# EAGLE design PCB_Robotique_V3 (EAGLE 8.4.3)
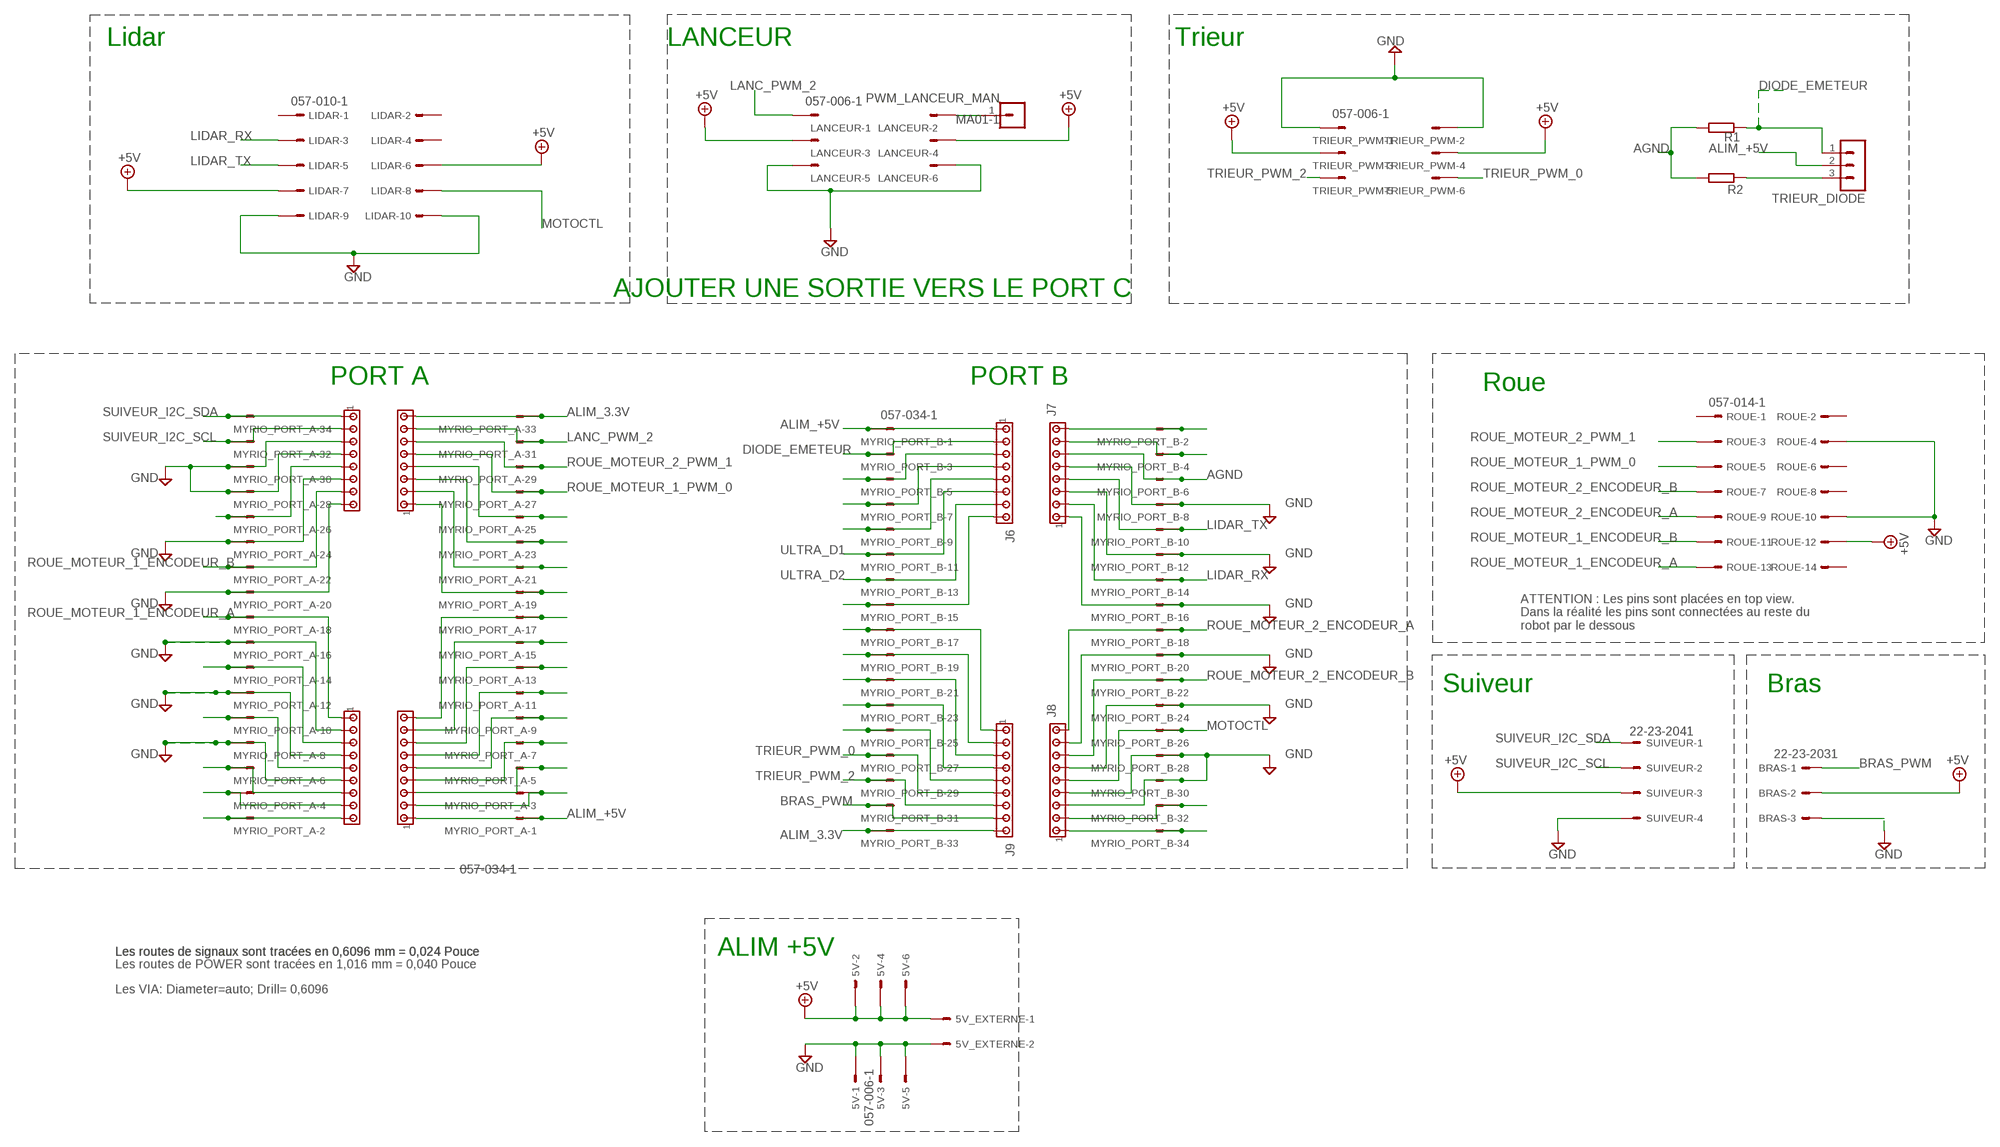
[diagram p0: schematic, sheet 1]

## Parts
5V  057-006-1  [057-006-1]
5V_EXTERNE  KK-156-2  [KK-156-2]
BRAS  22-23-2031  [22-23-2031]
J2  MTA08-100  [10X08MTA]
J3  MTA08-100  [10X08MTA]
J4  MTA09-100  [10X09MTA]
J5  MTA09-100  [10X09MTA]
J6  MTA08-100  [10X08MTA]
J7  MTA08-100  [10X08MTA]
J8  MTA09-100  [10X09MTA]
J9  MTA09-100  [10X09MTA]
LANCEUR  057-006-1  [057-006-1]
LIDAR  057-010-1  [057-010-1]
MYRIO_PORT_A  057-034-1  [057-034-1]
MYRIO_PORT_B  057-034-1  [057-034-1]
PWM_LANCEUR_MAN  MA01-1  [MA01-1]
R1  15K  R1/4W  [R]
R2  180  R1/4W  [R]
ROUE  057-014-1  [057-014-1]
SUIVEUR  22-23-2041  [22-23-2041]
TRIEUR_DIODE  MA03-1  [MA03-1]
TRIEUR_PWM  057-006-1  [057-006-1]

## Nets
4B: J7.7 MYRIO_PORT_B.4
+5V: 5V.2 5V.4 5V.6 5V_EXTERNE.1 BRAS.2 LANCEUR.3 LANCEUR.4 LIDAR.6 LIDAR.7 ROUE.12 SUIVEUR.3 TRIEUR_PWM.3 TRIEUR_PWM.4
AGND: J7.6 MYRIO_PORT_B.6 R1.1 R2.2
ALIM_3.3V: J3.8 J9.9 MYRIO_PORT_A.33 MYRIO_PORT_B.33
ALIM_+5V: J4.1 J6.1 MYRIO_PORT_A.1 MYRIO_PORT_B.1 TRIEUR_DIODE.2
BRAS_PWM: BRAS.1 J9.8 MYRIO_PORT_B.31
DIODE: R2.1 TRIEUR_DIODE.3
DIODE_EMETEUR: J6.2 MYRIO_PORT_B.3 R1.2 TRIEUR_DIODE.1
GND: 5V.1 5V.3 5V.5 5V_EXTERNE.2 BRAS.3 J2.3 J2.4 J2.6 J2.8 J5.2 J5.4 J5.6 J7.1 J7.3 J7.5 J8.3 J8.4 J8.6 J8.8 LANCEUR.5 LANCEUR.6 LIDAR.9 LIDAR.10 MYRIO_PORT_A.8 MYRIO_PORT_A.12 MYRIO_PORT_A.16 MYRIO_PORT_A.20 MYRIO_PORT_A.24 MYRIO_PORT_A.28 MYRIO_PORT_A.30 MYRIO_PORT_B.8 MYRIO_PORT_B.12 MYRIO_PORT_B.16 MYRIO_PORT_B.20 MYRIO_PORT_B.24 MYRIO_PORT_B.28 MYRIO_PORT_B.30 ROUE.4 ROUE.10 SUIVEUR.4 TRIEUR_PWM.1 TRIEUR_PWM.2
LANC_PWM_2: J3.7 LANCEUR.1 MYRIO_PORT_A.31
LIDAR_RX: J7.2 LIDAR.3 MYRIO_PORT_B.14
LIDAR_TX: J7.4 LIDAR.5 MYRIO_PORT_B.10
MOTOCTL: J8.5 LIDAR.8 MYRIO_PORT_B.26
N$3: J2.5 MYRIO_PORT_A.26
N$7: J7.8 MYRIO_PORT_B.2
N$13: J5.8 MYRIO_PORT_A.4
N$14: J5.9 MYRIO_PORT_A.2
N$16: J3.4 MYRIO_PORT_A.25
N$17: J3.3 MYRIO_PORT_A.23
N$18: J3.2 MYRIO_PORT_A.21
N$19: J3.1 MYRIO_PORT_A.19
N$20: J4.9 MYRIO_PORT_A.17
N$24: J4.8 MYRIO_PORT_A.15
N$25: J4.7 MYRIO_PORT_A.13
N$26: J4.6 MYRIO_PORT_A.11
N$27: J4.5 MYRIO_PORT_A.9
N$28: J4.4 MYRIO_PORT_A.7
N$29: J4.3 MYRIO_PORT_A.5
N$30: J4.2 MYRIO_PORT_A.3
N$38: J8.2 MYRIO_PORT_B.32
N$39: J8.1 MYRIO_PORT_B.34
N$41: J9.5 MYRIO_PORT_B.25
N$42: J9.4 MYRIO_PORT_B.23
N$43: J9.3 MYRIO_PORT_B.21
N$44: J9.2 MYRIO_PORT_B.19
N$45: J9.1 MYRIO_PORT_B.17
N$46: J6.8 MYRIO_PORT_B.15
N$47: J6.5 MYRIO_PORT_B.9
N$48: J6.4 MYRIO_PORT_B.7
N$49: J6.3 MYRIO_PORT_B.5
N$59: J5.7 MYRIO_PORT_A.6
PWM_LANCEUR_MAN: LANCEUR.2 PWM_LANCEUR_MAN.1
ROUE_MOTEUR_1_ENCODEUR_A: J5.1 MYRIO_PORT_A.18 ROUE.13
ROUE_MOTEUR_1_ENCODEUR_B: J2.7 MYRIO_PORT_A.22 ROUE.11
ROUE_MOTEUR_1_PWM_0: J3.5 MYRIO_PORT_A.27 ROUE.5
ROUE_MOTEUR_2_ENCODEUR_A: J8.9 MYRIO_PORT_B.18 ROUE.9
ROUE_MOTEUR_2_ENCODEUR_B: J8.7 MYRIO_PORT_B.22 ROUE.7
ROUE_MOTEUR_2_PWM_1: J3.6 MYRIO_PORT_A.29 ROUE.3
SDFSDFSGD: J5.5 MYRIO_PORT_A.10
SDSSDFD: J5.3 MYRIO_PORT_A.14
SUIVEUR_I2C_SCL: J2.2 MYRIO_PORT_A.32 SUIVEUR.2
SUIVEUR_I2C_SDA: J2.1 MYRIO_PORT_A.34 SUIVEUR.1
TRIEUR_PWM_0: J9.6 MYRIO_PORT_B.27 TRIEUR_PWM.6
TRIEUR_PWM_2: J9.7 MYRIO_PORT_B.29 TRIEUR_PWM.5
ULTRA_D1: J6.6 MYRIO_PORT_B.11
ULTRA_D2: J6.7 MYRIO_PORT_B.13
Unconnected: LIDAR.1 LIDAR.2 LIDAR.4 ROUE.1 ROUE.2 ROUE.6 ROUE.8 ROUE.14

## Notes on the sheet
- Lidar | LANCEUR | Trieur
- AJOUTER UNE SORTIE VERS LE PORT C
- PORT A | PORT B
- Roue
- ATTENTION : Les pins sont placées en top view. 
  Dans la réalité les pins sont connectées au reste du 
  robot par le dessous
- Suiveur | Bras
- Les routes de signaux sont tracées en 0,6096 mm = 0,024 Pouce | Les routes de signaux sont tracées en 0,6096 mm = 0,024 Pouce | ALIM +5V
- Les routes de POWER sont tracées en 1,016 mm = 0,040 Pouce
- Les VIA: Diameter=auto; Drill= 0,6096

## Library data of the parts
5V LANCEUR TRIEUR_PWM = con-panduit:057-006-: CONNECTOR 6-pin series 057 contact pc board low profile headers; OC_FARNELL: unknown; OC_NEWARK: unknown
5V_EXTERNE = isenproject:KK-156-2: KK 156 HEADER Source: http://www.molex.com/pdm_docs/sd/026604100_sd.pdf; OC_FARNELL: unknown; OC_NEWARK: unknown
BRAS = con-molex:22-23-2031: .100" (2.54mm) Center Header - 3 Pin; MF: MOLEX; MPN: 22-23-2031; OC_FARNELL: 1462950; OC_NEWARK: 30C0862
J2 J3 J6 J7 = con-amp:MTA08-100: AMP connector
J4 J5 J8 J9 = con-amp:MTA09-100: AMP connector
LIDAR = con-panduit:057-010-: CONNECTOR 10-pin series 057 contact pc board low profile headers; OC_FARNELL: unknown; OC_NEWARK: unknown
MYRIO_PORT_A MYRIO_PORT_B = con-panduit:057-034-: CONNECTOR 34-pin series 057 contact pc board low profile headers; OC_FARNELL: unknown; OC_NEWARK: unknown
PWM_LANCEUR_MAN = connecteurs_males:MA01-1
R1 R2 = isenproject:R: RESISTOR, European symbol
ROUE = con-panduit:057-014-: CONNECTOR 10-pin series 057 contact pc board low profile headers; OC_FARNELL: unknown; OC_NEWARK: unknown
SUIVEUR = con-molex:22-23-2041: .100" (2.54mm) Center Header - 4 Pin; MF: MOLEX; MPN: 22-23-2041; OC_FARNELL: 1462920; OC_NEWARK: 38C0355
TRIEUR_DIODE = connecteurs_males:MA03-1: PIN HEADER; OC_FARNELL: unknown; OC_NEWARK: unknown

## Board
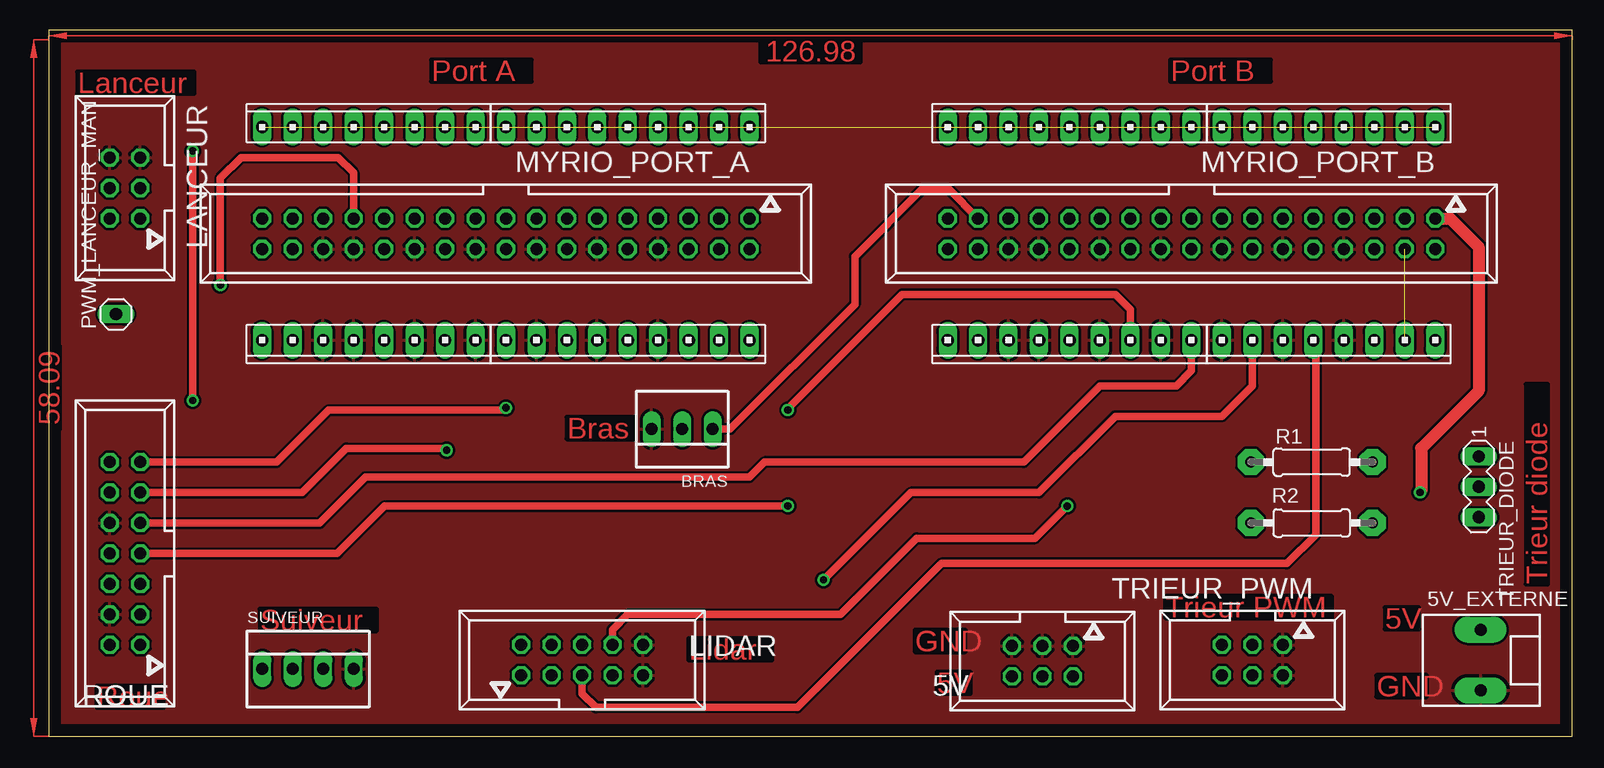
[diagram p1: board, top side]
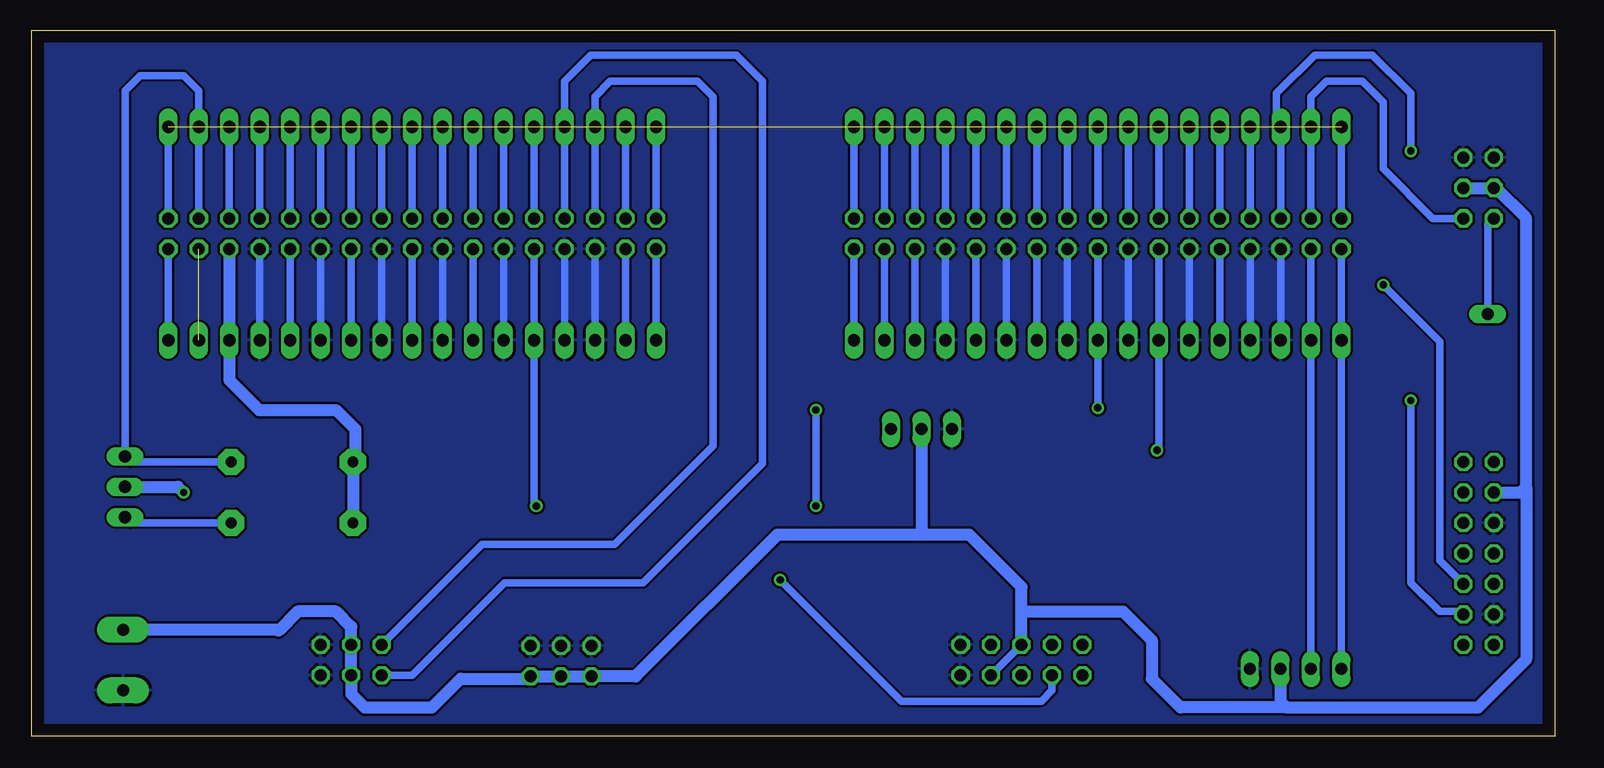
[diagram p2: board, bottom side, seen from below]

Size 126.98 x 58.89 mm. Coordinates in mm from the lower left corner, seen from the top.
Outline: 0,0 126.98,0 126.98,58.89 0,58.89 0,0
Copper layers (1*16): Top 0.035mm / dielectric 1.5mm / Bottom 0.035mm
Design rules "default": minimum track width 10mil, minimum drill 24mil, track to track 8mil, track to pad 8mil, pad to pad 8mil, via to via 8mil, smd to smd 8mil, copper to edge 40mil, drill to drill 8mil, minimum pad ring 10mil, minimum via ring 8mil, stop-mask expansion 4mil, vias tented up to drill 0mil, thermal gap 10mil

### Footprints (pad centres in the part's own frame; a part is rotated, then mirrored left to right if it is on the bottom)
057-006-1 = drill 1 octagon: 1 -2.54,-1.27; 2 -2.54,1.27; 3 0,-1.27; 4 0,1.27; 5 2.54,-1.27; 6 2.54,1.27
KK-156-2 = drill 1 pad 2.184 long: 1 -2.54,0; 2 2.54,0
22-23-2031 = drill 1 long: 1 -2.54,0; 2 0,0; 3 2.54,0
10X08MTA = drill 1.016 long: 1 8.89,0; 2 6.35,0; 3 3.81,0; 4 1.27,0; 5 -1.27,0; 6 -3.81,0; 7 -6.35,0; 8 -8.89,0
10X09MTA = drill 1.016 long: 1 10.16,0; 2 7.62,0; 3 5.08,0; 4 2.54,0; 5 0,0; 6 -2.54,0; 7 -5.08,0; 8 -7.62,0; 9 -10.16,0
057-010-1 = drill 1 octagon: 1 -5.08,-1.27; 2 -5.08,1.27; 3 -2.54,-1.27; 4 -2.54,1.27; 5 0,-1.27; 6 0,1.27; 7 2.54,-1.27; 8 2.54,1.27; 9 5.08,-1.27; 10 5.08,1.27
057-034-1 = drill 1 octagon: 1 -20.32,-1.27; 2 -20.32,1.27; 3 -17.78,-1.27; 4 -17.78,1.27; 5 -15.24,-1.27; 6 -15.24,1.27; 7 -12.7,-1.27; 8 -12.7,1.27; 9 -10.16,-1.27; 10 -10.16,1.27; 11 -7.62,-1.27; 12 -7.62,1.27; 13 -5.08,-1.27; 14 -5.08,1.27; 15 -2.54,-1.27; 16 -2.54,1.27; 17 0,-1.27; 18 0,1.27; 19 2.54,-1.27; 20 2.54,1.27; 21 5.08,-1.27; 22 5.08,1.27; 23 7.62,-1.27; 24 7.62,1.27; 25 10.16,-1.27; 26 10.16,1.27; 27 12.7,-1.27; 28 12.7,1.27; 29 15.24,-1.27; 30 15.24,1.27; 31 17.78,-1.27; 32 17.78,1.27; 33 20.32,-1.27; 34 20.32,1.27
MA01-1 = drill 1.016 long: 1 0,0
R = drill 0.9 pad 2.184 octagon: 1 -5.08,0; 2 5.08,0
057-014-1 = drill 1 octagon: 1 -7.62,-1.27; 2 -7.62,1.27; 3 -5.08,-1.27; 4 -5.08,1.27; 5 -2.54,-1.27; 6 -2.54,1.27; 7 0,-1.27; 8 0,1.27; 9 2.54,-1.27; 10 2.54,1.27; 11 5.08,-1.27; 12 5.08,1.27; 13 7.62,-1.27; 14 7.62,1.27
22-23-2041 = drill 1 long: 1 -3.81,0; 2 -1.27,0; 3 1.27,0; 4 3.81,0
MA03-1 = drill 1.016 long: 1 -2.54,0; 2 0,0; 3 2.54,0

### Placement (x,y rotation side)
5V  82.84,6.25 180 top
5V_EXTERNE  119.35,6.35 270 top
BRAS  52.8,25.6 180 top
J2  26.67,33.02 180 top
J3  26.67,50.8 0 top
J4  48.26,50.8 0 top
J5  48.26,33.02 180 top
J6  106.68,50.8 0 top
J7  106.68,33.02 180 top
J8  85.09,33.02 180 top
J9  85.09,50.8 0 top
LANCEUR  6.35,45.72 90 top
LIDAR  44.45,6.35 0 top
MYRIO_PORT_A  38.1,41.91 180 top
MYRIO_PORT_B  95.25,41.91 180 top
PWM_LANCEUR_MAN  5.6,35.2 90 top
R1  105.27,22.86 0 top
R2  105.27,17.78 180 top
ROUE  6.35,15.24 90 top
SUIVEUR  21.6,5.6 0 top
TRIEUR_DIODE  119.2,20.8 270 top
TRIEUR_PWM  100.33,6.35 180 top

### Tracks (layer width: path | path; a pad name or v marks a point on that pad's centre or on a via)
4B  (1 unrouted)
+5V
  Bottom 0.61: LIDAR.7 LIDAR.6 | 100,7.95 TRIEUR_PWM.3 | 100,4.75 TRIEUR_PWM.4 | 5V.6 80.12,4.8
  Bottom 1.016: 5V_EXTERNE.1 106.49,8.89 106.4,8.8 104.8,10.4 101.6,10.4 100.33,9.13 TRIEUR_PWM.3 TRIEUR_PWM.4 100.33,3.53 99.2,2.4 93.6,2.4 91.2,4.8 85.56,4.8 5V.2 5V.4 5V.6 76.62,4.98 64.8,16.8 52.8,16.8 | BRAS.2 52.8,16.8 | 52.8,16.8 48.8,16.8 44.45,12.45 44.45,10.4 | LIDAR.6 44.45,10.4 | 44.45,10.4 36,10.4 33.6,8 33.6,4.8 31.2,2.4 22.4,2.4 | 22.4,2.4 6.4,2.4 2.4,6.4 2.4,20.8 | 2.4,20.8 2.4,43.2 4.92,45.72 LANCEUR.4 LANCEUR.3 | SUIVEUR.3 22.87,2.87 22.4,2.4 | ROUE.12 2.88,20.32 2.4,20.8
AGND
  Bottom 1.016: MYRIO_PORT_B.6 J7.6 110.49,29.69 108,27.2 101.6,27.2 100,25.6 100,23.05 R1.1 R2.2
ALIM_3.3V  (1 unrouted)
  Bottom 0.61: J3.8 MYRIO_PORT_A.33 | MYRIO_PORT_B.33 J9.9
ALIM_+5V  (via drill 0.61)  (1 unrouted)
  Top 1.016: MYRIO_PORT_B.1 116.78,43.18 116.8,43.2 119.2,40.8 119.2,28.8 114.4,24 114.4,20.42 v114.3,20.32
  Bottom 0.61: J6.1 MYRIO_PORT_B.1 | MYRIO_PORT_A.1 J4.1 | 118.72,20.32 TRIEUR_DIODE.2
  Bottom 1.016: TRIEUR_DIODE.2 114.78,20.8 v114.3,20.32
BRAS_PWM
  Top 0.61: MYRIO_PORT_B.31 75.05,45.6 72.8,45.6 67.2,40 67.2,36 56.8,25.6 BRAS.1
  Bottom 0.61: J9.8 MYRIO_PORT_B.31
DIODE
  Bottom 0.61: R2.1 118.72,17.78 TRIEUR_DIODE.3
DIODE_EMETEUR
  Bottom 0.61: MYRIO_PORT_B.3 J6.2 113.03,53.81 114.3,55.08 117.92,55.08 119.19,53.81 TRIEUR_DIODE.1 119.13,23.27 | R1.2 118.72,22.86 119.13,23.27 | 119.13,23.27 TRIEUR_DIODE.1
GND
  Bottom 0.61: MYRIO_PORT_A.28 J2.4 | MYRIO_PORT_A.24 J2.6 | MYRIO_PORT_A.20 J2.8 | MYRIO_PORT_A.16 J5.2 | MYRIO_PORT_B.28 J8.4 | J8.3 MYRIO_PORT_B.30 | MYRIO_PORT_B.24 J8.6 | J7.5 MYRIO_PORT_B.8 | J7.3 MYRIO_PORT_B.12 | MYRIO_PORT_B.16 J7.1 | MYRIO_PORT_A.30 J2.3 | MYRIO_PORT_B.20 J8.8 | J5.6 MYRIO_PORT_A.8 | J5.4 MYRIO_PORT_A.12
  pour Top: -3.2,-2.4 128.8,-2.4 128.8,62.4 -3.2,62.4
  pour Bottom: -4,-4.8 130.4,-4.8 130.4,63.2 -4,63.2
LANC_PWM_2
  Bottom 0.61: MYRIO_PORT_A.31 J3.7 20.32,53.34 19.05,54.61 16.04,54.61 14.3,52.87 14.3,47.32 10.16,43.18 LANCEUR.1
LIDAR_RX  (via drill 0.61)
  Top 0.61: 100.33,31.75 J7.2 100.33,29.21 97.79,26.67 88.9,26.67 82.55,20.32 71.87,20.32 v64.58,13.03
  Bottom 0.61: J7.2 MYRIO_PORT_B.14 | LIDAR.3 41.91,3.81 42.8,2.92 54.47,2.92 v64.58,13.03
LIDAR_TX
  Top 0.61: J7.4 105.6,32.83 105.6,16.8 103.2,14.4 74.4,14.4 62.4,2.4 45.6,2.4 44.45,3.55 LIDAR.5
  Bottom 0.61: MYRIO_PORT_B.10 J7.4
MOTOCTL  (via drill 0.61)
  Top 0.61: LIDAR.8 46.99,8.89 48.25,10.15 | 48.25,10.15 48.26,10.16 | v84.9,19.19 82.22,16.51 72.34,16.51 65.98,10.15 48.25,10.15
  Bottom 0.61: MYRIO_PORT_B.26 J8.5 85.09,19.38 v84.9,19.19
N$3
  Bottom 0.61: J2.5 MYRIO_PORT_A.26
N$7
  Bottom 0.61: MYRIO_PORT_B.2 J7.8
N$13
  Bottom 0.61: J5.8 MYRIO_PORT_A.4
N$14
  Bottom 0.61: J5.9 MYRIO_PORT_A.2
N$16
  Bottom 0.61: MYRIO_PORT_A.25 J3.4
N$17
  Bottom 0.61: MYRIO_PORT_A.23 J3.3
N$18
  Bottom 0.61: MYRIO_PORT_A.21 J3.2
N$19
  Bottom 0.61: MYRIO_PORT_A.19 J3.1
N$20
  Bottom 0.61: MYRIO_PORT_A.17 J4.9
N$24
  Bottom 0.61: MYRIO_PORT_A.15 J4.8
N$25
  Bottom 0.61: MYRIO_PORT_A.13 J4.7
N$26
  Bottom 0.61: J4.6 MYRIO_PORT_A.11
N$27
  Bottom 0.61: MYRIO_PORT_A.9 J4.5
N$28
  Bottom 0.61: J4.4 MYRIO_PORT_A.7
N$29
  Bottom 0.61: MYRIO_PORT_A.5 J4.3
N$30
  Bottom 0.61: J4.2 MYRIO_PORT_A.3
N$38
  Bottom 0.61: MYRIO_PORT_B.32 J8.2
N$39
  Bottom 0.61: J8.1 MYRIO_PORT_B.34
N$41
  Bottom 0.61: MYRIO_PORT_B.25 J9.5
N$42
  Bottom 0.61: MYRIO_PORT_B.23 J9.4
N$43
  Bottom 0.61: MYRIO_PORT_B.21 J9.3
N$44
  Bottom 0.61: J9.2 MYRIO_PORT_B.19
N$45
  Bottom 0.61: MYRIO_PORT_B.17 J9.1
N$46
  Bottom 0.61: J6.8 MYRIO_PORT_B.15
N$47
  Bottom 0.61: MYRIO_PORT_B.9 J6.5
N$48
  Bottom 0.61: J6.4 MYRIO_PORT_B.7
N$49
  Bottom 0.61: MYRIO_PORT_B.5 J6.3
N$59
  Bottom 0.61: J5.7 MYRIO_PORT_A.6
PWM_LANCEUR_MAN
  Bottom 0.61: LANCEUR.2 5.6,42.66 PWM_LANCEUR_MAN.1
ROUE_MOTEUR_1_ENCODEUR_A  (via drill 0.61)
  Top 0.61: ROUE.13 18.99,22.86 23.33,27.2 37.92,27.2 v38.1,27.38
  Bottom 0.61: 38.1,34.29 J5.1 | J5.1 MYRIO_PORT_A.18 | J5.1 v38.1,27.38
ROUE_MOTEUR_1_ENCODEUR_B  (via drill 0.61)
  Top 0.61: ROUE.11 21.12,20.32 24.8,24 33.01,24 v33.16,23.85
  Bottom 0.61: MYRIO_PORT_A.22 J2.7 33.02,23.99 v33.16,23.85
ROUE_MOTEUR_1_PWM_0  (via drill 0.61)
  Top 0.61: MYRIO_PORT_A.27 25.4,46.99 24.13,48.26 16.04,48.26 14.3,46.52 v14.3,37.63
  Bottom 0.61: MYRIO_PORT_A.27 J3.5 | v14.3,37.63 9.6,32.93 9.6,14.68 ROUE.5
ROUE_MOTEUR_2_ENCODEUR_A
  Top 0.61: J8.9 95.25,30.48 93.98,29.21 87.63,29.21 81.28,22.86 59.66,22.86 58.4,21.6 26.4,21.6 22.58,17.78 ROUE.9
  Bottom 0.61: 95.25,34.29 J8.9 MYRIO_PORT_B.18
ROUE_MOTEUR_2_ENCODEUR_B  (via drill 0.61)
  Top 0.61: J8.7 90.17,35.56 88.9,36.83 71.12,36.83 61.6,27.31 v61.6,27.2 | ROUE.7 24.04,15.24 28,19.2 v61.6,19.2
  Bottom 0.61: J8.7 MYRIO_PORT_B.22 | v61.6,27.2 v61.6,19.2
ROUE_MOTEUR_2_PWM_1  (via drill 0.61)
  Top 0.61: v12,48.8 v12,28
  Bottom 0.61: MYRIO_PORT_A.29 J3.6 23.2,51.14 23.2,53.6 20,56.8 15.2,56.8 12,53.6 v12,48.8 | ROUE.3 7.86,10.4 9.6,10.4 12,12.8 v12,28
SDFSDFSGD
  Bottom 0.61: J5.5 MYRIO_PORT_A.10
SDSSDFD
  Bottom 0.61: J5.3 MYRIO_PORT_A.14
SUIVEUR_I2C_SCL
  Bottom 0.61: MYRIO_PORT_A.32 J2.2 SUIVEUR.2
SUIVEUR_I2C_SDA
  Bottom 0.61: MYRIO_PORT_A.34 J2.1 SUIVEUR.1
TRIEUR_PWM_0
  Bottom 0.61: MYRIO_PORT_B.27 J9.6 82.55,54.61 80.39,56.77 68.2,56.77 66.04,54.61 66.04,22.76 76,12.8 87.53,12.8 95.25,5.08 TRIEUR_PWM.6
TRIEUR_PWM_2
  Bottom 0.61: MYRIO_PORT_B.29 J9.7 80.01,53.34 78.74,54.61 71.45,54.61 70.18,53.34 70.18,24.22 78.4,16 89.41,16 TRIEUR_PWM.5
ULTRA_D1
  Bottom 0.61: J6.6 MYRIO_PORT_B.11
ULTRA_D2
  Bottom 0.61: MYRIO_PORT_B.13 J6.7
(copper drawn outside any net)
  shapes: Top area x2

### Text on the board
Top: Port A | Port B | Lanceur | Bras | Trieur diode | Trieur PWM | Suiveur | 5V | GND | Lidar | 5V | GND | Roue